# Altium schematic sheet PWR_IN.SchDoc
size A4; SheetNumber: 3; SheetTotal: 9
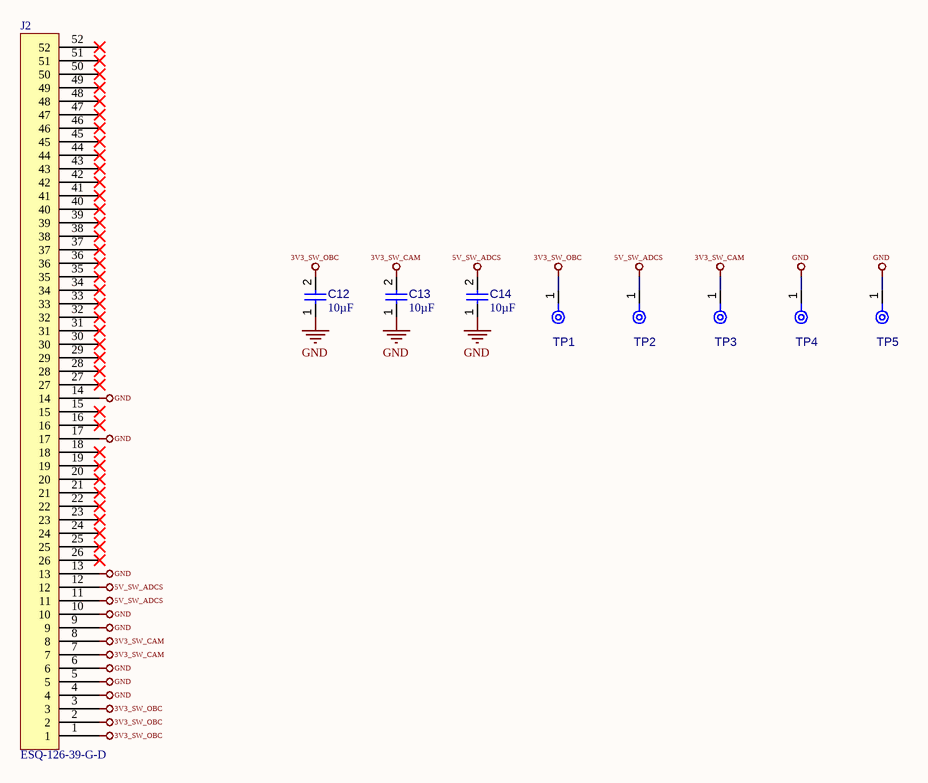
[diagram p0: PWR_IN.SchDoc]

## Parts
C12  value 10µF  [CAPC0805(2012)145_L]  (hidden comment: Capacitor 10µF +/-20% 25V 0805)
C13  value 10µF  [CAPC0805(2012)145_L]  (hidden comment: Capacitor 10µF +/-20% 25V 0805)
C14  value 10µF  [CAPC0805(2012)145_L]  (hidden comment: Capacitor 10µF +/-20% 25V 0805)
J2  ESQ-126-39-G-D  [CONN_ESQ-126-39-G-D_SAI]
TP1  TPAD6R  [TP06R]  (value not drawn)  (no BOM)
TP2  TPAD6R  [TP06R]  (value not drawn)  (no BOM)
TP3  TPAD6R  [TP06R]  (value not drawn)  (no BOM)
TP4  TPAD6R  [TP06R]  (value not drawn)  (no BOM)
TP5  TPAD6R  [TP06R]  (value not drawn)  (no BOM)

## Nets
3V3_SW_CAM: C13.2 J2.7 J2.8 TP3.1(TP)
3V3_SW_OBC: C12.2 J2.1 J2.2 J2.3 TP1.1(TP)
5V_SW_ADCS: C14.2 J2.11 J2.12 TP2.1(TP)
GND: C12.1 C13.1 C14.1 J2.4 J2.5 J2.6 J2.9 J2.10 J2.13 J2.14 J2.17 TP4.1(TP) TP5.1(TP)

Not connected (* = marked no-connect by the designer): J2 15* 16* 18* 19* 20* 21* 22* 23* 24* 25* 26* 27* 28* 29* 30* 31* 32* 33* 34* 35* 36* 37* 38* 39* 40* 41* 42* 43* 44* 45* 46* 47* 48* 49* 50* 51* 52*

## Library data of the parts
C12-C14 = CMP-001-00079-4: Chip Capacitor, 10µF +/-20%, 25V, 0805, Thickness 1.45 mm; Tolerance: 10%; Max Operating Temperature: 85°C; Case/Package: 0805; Voltage Rating: 25V; Min Operating Temperature: -55°C; Mounting Technology: SMT; Pins: 2
J2 = CMP-002-00077-3: Samtec ESQ Series, 2.54mm Pitch, 52-Pin Double Row Receptacle, Board-to-Board, Right Angle, TH; Manufacturer Lifecycle Status: PRODUCTION; Max Voltage Rating (AC): 550V; Contact Resistance: 10mΩ; Number of Contacts: 52; Max Current Rating: 6.9A; Housing Color: Black; Max Operating Temperature: 125°C; Depth: 4.95mm; Radiation Hardening: No; RoHS: Compliant; Housing Material: Polyester; Pitch: 2.54mm; Number of Rows: 2; Orientation: Straight; Length: 66.55mm; Lifecycle Status: Production; Packaging: Bulk; Contact Plating: Gold; Termination: Solder; Pins: 52; Min Operating Temperature: -55°C; Contact Material: Bronze
TP1-TP5 = CMP-00028-00002-2: 0.6mm round; Pins: 1